# Altium schematic sheet HDMI PHY _ IO1.schdoc
size 297 x 209 mm; Symbol: Drawing-Symbol_A4; Company: 嘉立创EDA; Version: V1.0; Page Size: A4; @Project Name: RK3566; @Update Date: 2026-06-03; @Create Date: 2026-05-19; Device: Drawing-Symbol_A4; @Board Name: Board1; @Page Name: P2; @Create Time: 03:19:25; @Page Count: 8; @Page No: 8; @Schematic Name: Schematic1; @Update Time: 03:19:25; @Assembly Variant: Basic; Border: 1; Title Block Position: 3; Size: A4; Width: 1170; Height: 825; Region Start: 1; X Region Count: 6; Y Region Count: 4; Blade Width: 10; SheetNumber: 1; SheetTotal: 11
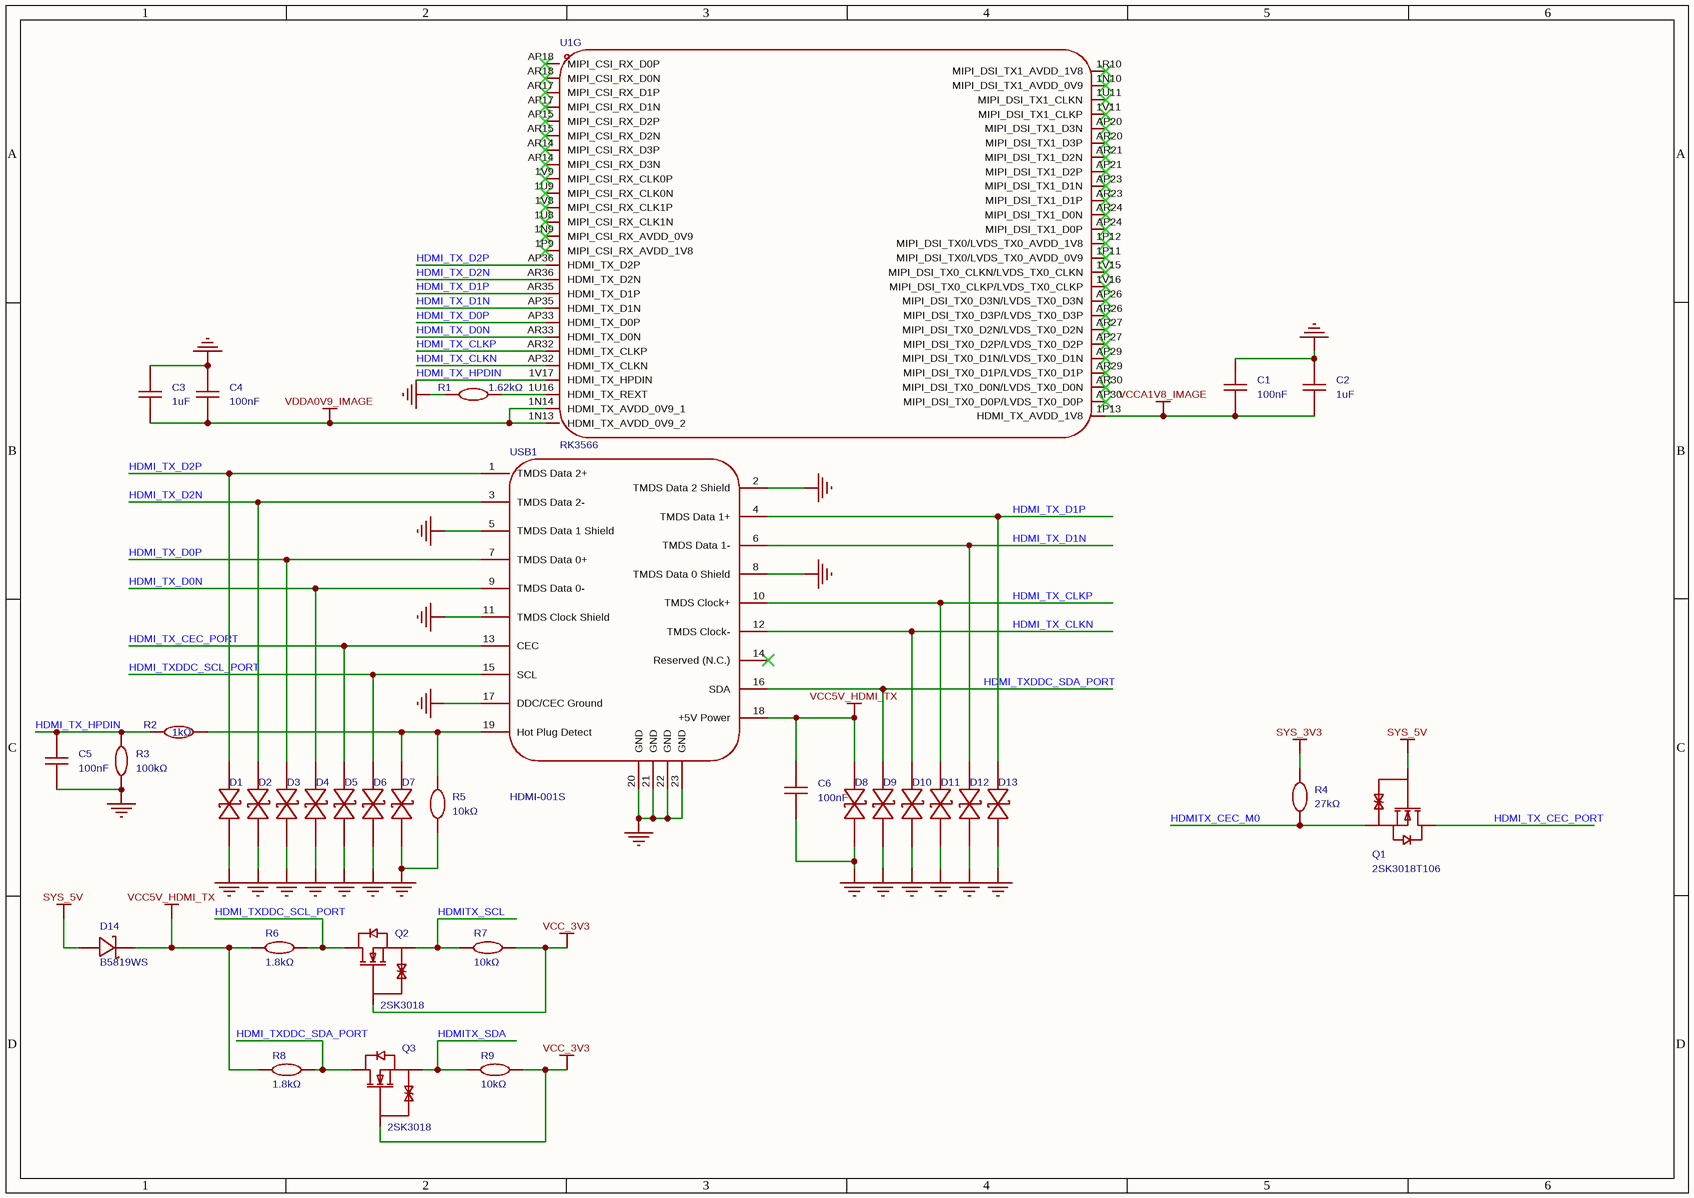
[diagram p0: HDMI PHY _ IO1.schdoc]

## Parts
C1  100nF  [C0402]
C2  1uF  [C0402]
C3  1uF  [C0402]
C4  100nF  [C0402]
C5  100nF  [C0402]
C6  100nF  [C0402]
D1  BDFN1C051R  [DFN0603-D_L0.6-W0.3-P0.34-BI]  (value not drawn)
D2  BDFN1C051R  [DFN0603-D_L0.6-W0.3-P0.34-BI]  (value not drawn)
D3  BDFN1C051R  [DFN0603-D_L0.6-W0.3-P0.34-BI]  (value not drawn)
D4  BDFN1C051R  [DFN0603-D_L0.6-W0.3-P0.34-BI]  (value not drawn)
D5  BDFN1C051R  [DFN0603-D_L0.6-W0.3-P0.34-BI]  (value not drawn)
D6  BDFN1C051R  [DFN0603-D_L0.6-W0.3-P0.34-BI]  (value not drawn)
D7  BDFN1C051R  [DFN0603-D_L0.6-W0.3-P0.34-BI]  (value not drawn)
D8  BDFN1C051R  [DFN0603-D_L0.6-W0.3-P0.34-BI]  (value not drawn)
D9  BDFN1C051R  [DFN0603-D_L0.6-W0.3-P0.34-BI]  (value not drawn)
D10  BDFN1C051R  [DFN0603-D_L0.6-W0.3-P0.34-BI]  (value not drawn)
D11  BDFN1C051R  [DFN0603-D_L0.6-W0.3-P0.34-BI]  (value not drawn)
D12  BDFN1C051R  [DFN0603-D_L0.6-W0.3-P0.34-BI]  (value not drawn)
D13  BDFN1C051R  [DFN0603-D_L0.6-W0.3-P0.34-BI]  (value not drawn)
D14  B5819WS  [SOD-323_L1.8-W1.3-LS2.5-RD]
Q1  2SK3018T106  [SOT-323_L2.0-W1.3-P1.30-LS2.1-TR]
Q2  2SK3018  [SOT-323-3_L2.0-W1.3-P1.30-LS2.1-BR]
Q3  2SK3018  [SOT-323-3_L2.0-W1.3-P1.30-LS2.1-BR]
R1  1.62kΩ  [R0402]
R2  1kΩ  [R0402]
R3  100kΩ  [R0402]
R4  27kΩ  [R0402]
R5  10kΩ  [R0402]
R6  1.8kΩ  [R0402]
R7  10kΩ  [R0402]
R8  1.8kΩ  [R0402]
R9  10kΩ  [R0402]
U1  RK3566  [BGA-565_L15.5-W14.4-P0.40_RK3566_1]  (part G of 8)
USB1  HDMI-001S  [HDMI-SMD_HDMI-001S]

## Nets
GND: C1.2 C2.2 C3.2 C4.2 C5.2 C6.2 D1.1 D2.1 D3.1 D4.1 D5.1 D6.1 D7.1 D8.1 D9.1 D10.1 D11.1 D12.1 D13.1 R1.2 R3.1 R5.1 USB1.2(TMDS_Data_2_Shield) USB1.5(TMDS_Data_1_Shield) USB1.8(TMDS_Data_0_Shield) USB1.11(TMDS_Clock_Shield) USB1.17(DDC/CEC_Ground) USB1.20(GND) USB1.21(GND) USB1.22(GND) USB1.23(GND)
SYS_3V3: R4.2
SYS_5V: D14.2(A) Q1.2(G)
VCC5V_HDMI_TX: C6.1 D8.2 D14.1(K) R6.1 R8.1 USB1.18(+5V_Power)
VCC_3V3: Q2.1(G) Q3.1(G) R7.1 R9.1
VCCA1V8_IMAGE: C1.1 C2.1 U1.1P13(HDMI_TX_AVDD_1V8)
VDDA0V9_IMAGE: C3.1 C4.1 U1.1N13(HDMI_TX_AVDD_0V9_2) U1.1N14(HDMI_TX_AVDD_0V9_1)
HDMI_TX_CEC_PORT: D5.2 Q1.3(D) USB1.13(CEC)
HDMI_TX_CLKN: D10.2 U1.AP32(HDMI_TX_CLKN) USB1.12(TMDS_Clock-)
HDMI_TX_CLKP: D11.2 U1.AR32(HDMI_TX_CLKP) USB1.10(TMDS_Clock+)
HDMI_TX_D0N: D4.2 U1.AR33(HDMI_TX_D0N) USB1.9(TMDS_Data_0-)
HDMI_TX_D0P: D3.2 U1.AP33(HDMI_TX_D0P) USB1.7(TMDS_Data_0+)
HDMI_TX_D1N: D12.2 U1.AP35(HDMI_TX_D1N) USB1.6(TMDS_Data_1-)
HDMI_TX_D1P: D13.2 U1.AR35(HDMI_TX_D1P) USB1.4(TMDS_Data_1+)
HDMI_TX_D2N: D2.2 U1.AR36(HDMI_TX_D2N) USB1.3(TMDS_Data_2-)
HDMI_TX_D2P: D1.2 U1.AP36(HDMI_TX_D2P) USB1.1(TMDS_Data_2+)
HDMI_TX_HPDIN: C5.1 R2.2 R3.2 U1.1V17(HDMI_TX_HPDIN)
HDMI_TXDDC_SCL_PORT: D6.2 Q2.3(D) R6.2 USB1.15(SCL)
HDMI_TXDDC_SDA_PORT: D9.2 Q3.3(D) R8.2 USB1.16(SDA)
HDMITX_CEC_M0: Q1.1(S) R4.1
HDMITX_SCL: Q2.2(S) R7.2
HDMITX_SDA: Q3.2(S) R9.2
NetD7_2: D7.2 R2.1 R5.2 USB1.19(Hot_Plug_Detect)
NetR1_1: R1.1 U1.1U16(HDMI_TX_REXT)

Not connected (* = marked no-connect by the designer): U1 1N9(MIPI_CSI_RX_AVDD_0V9)* 1N10(MIPI_DSI_TX1_AVDD_0V9)* 1P9(MIPI_CSI_RX_AVDD_1V8)* 1P11(MIPI_DSI_TX0/LVDS_TX0_AVDD_0V9)* 1P12(MIPI_DSI_TX0/LVDS_TX0_AVDD_1V8)* 1R10(MIPI_DSI_TX1_AVDD_1V8)* 1U8(MIPI_CSI_RX_CLK1N)* 1U9(MIPI_CSI_RX_CLK0N)* 1U11(MIPI_DSI_TX1_CLKN)* 1V8(MIPI_CSI_RX_CLK1P)* 1V9(MIPI_CSI_RX_CLK0P)* 1V11(MIPI_DSI_TX1_CLKP)* 1V15(MIPI_DSI_TX0_CLKN/LVDS_TX0_CLKN)* 1V16(MIPI_DSI_TX0_CLKP/LVDS_TX0_CLKP)* AP14(MIPI_CSI_RX_D3N)* AP15(MIPI_CSI_RX_D2P)* AP17(MIPI_CSI_RX_D1N)* AP18(MIPI_CSI_RX_D0P)* AP20(MIPI_DSI_TX1_D3N)* AP21(MIPI_DSI_TX1_D2P)* AP23(MIPI_DSI_TX1_D1N)* AP24(MIPI_DSI_TX1_D0P)* AP26(MIPI_DSI_TX0_D3N/LVDS_TX0_D3N)* AP27(MIPI_DSI_TX0_D2P/LVDS_TX0_D2P)* AP29(MIPI_DSI_TX0_D1N/LVDS_TX0_D1N)* AP30(MIPI_DSI_TX0_D0P/LVDS_TX0_D0P)* AR14(MIPI_CSI_RX_D3P)* AR15(MIPI_CSI_RX_D2N)* AR17(MIPI_CSI_RX_D1P)* AR18(MIPI_CSI_RX_D0N)* AR20(MIPI_DSI_TX1_D3P)* AR21(MIPI_DSI_TX1_D2N)* AR23(MIPI_DSI_TX1_D1P)* AR24(MIPI_DSI_TX1_D0N)* AR26(MIPI_DSI_TX0_D3P/LVDS_TX0_D3P)* AR27(MIPI_DSI_TX0_D2N/LVDS_TX0_D2N)* AR29(MIPI_DSI_TX0_D1P/LVDS_TX0_D1P)* AR30(MIPI_DSI_TX0_D0N/LVDS_TX0_D0N)*; USB1 14(Reserved_(N.C.))*

## Notes on the sheet
- 创建日期
- 2026-10-04
- 原理图
- 板子
- Schematic1
- Board1
- 更新日期
- 图页
- P2
- 绘制
- 审阅
- RK3566
- 版本
- V1.0
- 尺寸
- A4
- 页    8    共    8
- 嘉立创EDA

## Library data of the parts
C1 C4-C6 = CL05B104KO5NNNC: 容值:100nF;精度:±10%;额定电压:16V;温度系数:X7R;; Manufacturer: SAMSUNG(三星); 3D Model: 36a51122f27c49738f86b3bfa98863e0聨0819f05c4eef4c71ace90d822a990e87; 3D Model Transform: 39.37,19.685,0,0,0,0,0,0,0; Tolerance: ±10%; Voltage Rating: 16V; Temperature Coefficient: X7R; AddInBom: yes; ModelName: C0402_L1.0-W0.5-H0.5; Symbol: CL05B104KO5NNNC; Device: CL05B104KO5NNNC; LCSC Part Name: 100nF ±10% 16V; Supplier Part: C1525; Manufacturer Part: CL05B104KO5NNNC; Supplier Footprint: 0402; JLCPCB Part Class: Basic Part; Datasheet: https://item.szlcsc.com/datasheet/CL05B104KO5NNNC/1877.html; Supplier: LCSC; Value: 100nF; ConvertToPcb: yes; FootprintName: C0402
C2 C3 = HGC0402R5105K500NTEJ: 容值:1uF;精度:±10%;额定电压:50V;温度系数:X5R;; Manufacturer: Chinocera(华瓷); 3D Model: 36a51122f27c49738f86b3bfa98863e0聨0819f05c4eef4c71ace90d822a990e87; 3D Model Transform: 39.37,19.685,0,0,0,0,0,0,0; Tolerance: ±10%; Voltage Rating: 50V; Temperature Coefficient: X5R; AddInBom: yes; ModelName: C0402_L1.0-W0.5-H0.5; Symbol: HGC0402R5105K500NTEJ; Device: HGC0402R5105K500NTEJ; LCSC Part Name: 1uF ±10% 50V; Supplier Part: C7472948; Manufacturer Part: HGC0402R5105K500NTEJ; Supplier Footprint: 0402; JLCPCB Part Class: Extended Part; Datasheet: https://item.szlcsc.com/datasheet/HGC0402R5105K500NTEJ/8532795.html; Supplier: LCSC; Value: 1uF; ConvertToPcb: yes; FootprintName: C0402
D1-D13 = BDFN1C051R: 极性:双向;反向截止电压(Vrwm):5V;钳位电压:13V;峰值脉冲电流(Ipp):4A@8/20us;击穿电压(VBR):5.5V;; Manufacturer: BORN(伯恩半导体); AddInBom: yes; ModelId: 295ccb0e91f84fca9fcc42e8f031306b聨0819f05c4eef4c71ace90d822a990e87; ModelName: DFN0603-D_L0.6-W0.3--H0.3-P0.34-BI; ModelTransform: 24.0157,12.2047,0,0,0,0,0,0,0; Polarity: 双向; Reverse Stand-Off Voltage (Vrwm): 5V; Clamping Voltage: 13V; Voltage - Breakdown: 5.5V; Reverse Leakage Current (Ir): 100nA; Number of Channels: 单路; level of protection: IEC 61000-4-4；IEC 61000-4-5；IEC 61000-4-2; Type: ESD; Junction Capacitance: 0.2pF; Symbol: BDFN1C051R; Device: BDFN1C051R; LCSC Part Name: 双向ESD 5V截止 峰值脉冲电流：4A@8/20us; SupplierPart: C152032; ManufacturerPart: BDFN1C051R; Supplier Footprint: DFN0603-D; JLCPCB Part Class: Extended Part; Datasheet: https://item.szlcsc.com/datasheet/BDFN1C051R/163372.html; Supplier: LCSC; ConvertToPcb: yes; FootprintName: DFN0603-D_L0.6-W0.3-P0.34-BI; Peak Pulse Current (Ipp): 4A@8/20us
D14 = B5819WS_C22624: 直流反向耐压(Vr):40V;平均整流电流(Io):1A;正向压降(Vf):600mV@1A;; Manufacturer: CJ(江苏长电/长晶); 3D Model: e9dd044ee7bf4221b3b795eb56bce7c0; 3D Model Transform: 98.91933,51.181,0,180,0,0,0.985,-0.0005,0; Reverse Voltage (Vr): 40V; Average Rectified Current (Io): 1A; AddInBom: yes; ModelName: SOD-323_L1.7-W1.3-H1.1-LS2.5; Symbol: B5819WS_C22624; Device: B5819WS_C22624; LCSC Part Name: 40V 1A 600mV@1A; Supplier Part: C22624; Manufacturer Part: B5819WS; Supplier Footprint: SOD-323; JLCPCB Part Class: Extended Part; Datasheet: https://atta.szlcsc.com/upload/public/pdf/source/20170919/C22624_1505799673448977596.pdf; Supplier: LCSC; Forward Voltage (Vf@If): 600mV@1A; ConvertToPcb: yes; FootprintName: SOD-323_L1.8-W1.3-LS2.5-RD
Q1 = 2SK3018T106: 数量:1个N沟道;漏源电压(Vdss):30V;连续漏极电流(Id):100mA;导通电阻(RDS(on)):13Ω@2.5V;耗散功率(Pd):200mW;阈值电压(Vgs(th)):1.5V;; Manufacturer: ROHM(罗姆); AddInBom: yes; ModelId: 16cdee8f029a4e608a375d4e8ff80303聨0819f05c4eef4c71ace90d822a990e87; ModelTransform: 82.677,78.74,0,0,0,0,0,0,0; Number: 1个N沟道; Drain to Source Voltage: 30V; Current - Continuous Drain(Id): 100mA; Pd - Power Dissipation: 200mW; Gate Threshold Voltage (Vgs(th)): 1.5V; Input Capacitance(Ciss): 13pF; Reverse Transfer Capacitance (Crss@Vds): 4pF; Type: N沟道; Output Capacitance(Coss): 9pF; Vgs: ±20V; Symbol: 2SK3018T106; Device: 2SK3018T106; LCSC Part Name: 1个N沟道 耐压:30V 电流:100mA; SupplierPart: C113315; ManufacturerPart: 2SK3018T106; Supplier Footprint: SOT-323; JLCPCB Part Class: Extended Part; Datasheet: https://item.szlcsc.com/datasheet/2SK3018T106/114550.html; Supplier: LCSC; ConvertToPcb: yes; FootprintName: SOT-323_L2.0-W1.3-P1.30-LS2.1-TR; ModelName: SOT-323_L2.0-W1.3-P1.30-LS2.1-TR; RDS(on): 13Ω@2.5V; Gate Charge(Qg): -; Operating Temperature: -55℃~+150℃; Configuration: -
Q2 Q3 = 2SK3018_C194460: 类型:N沟道;漏源电压(Vdss):30V;连续漏极电流(Id):100mA;功率(Pd):200mW;导通电阻(RDS(on)@Vgs,Id):8Ω@4V,10mA;阈值电压(Vgs(th)@Id):1.5V@100uA;; Manufacturer: CJ(江苏长电/长晶); 3D Model: 59529c0d6fc749f28f2d0659e12986b4; 3D Model Transform: 78.74,82.677,0,90,0,0,0.0005,0,0; Type: N沟道; Drain Source Voltage (Vdss): 30V; Continuous Drain Current (Id): 100mA; Power Dissipation (Pd): 200mW; AddInBom: yes; ModelName: SOT-323-3_L2.0-W1.3-H1.0-LS2.1-P1.30; Symbol: 2SK3018_C194460; Device: 2SK3018_C194460; LCSC Part Name: N沟道 30V 100mA; Supplier Part: C194460; Manufacturer Part: 2SK3018; Supplier Footprint: SOT-323-3; JLCPCB Part Class: Extended Part; Datasheet: https://atta.szlcsc.com/upload/public/pdf/source/20180612/C194460_7DCC01674DB4E554C67F4CC0517F82F1.pdf; Supplier: LCSC; Drain Source On Resistance (RDS(on)@Vgs,Id): 8Ω@4V,10mA; Gate Threshold Voltage (Vgs(th)@Id): 1.5V@100uA; ConvertToPcb: yes; FootprintName: SOT-323-3_L2.0-W1.3-P1.30-LS2.1-BR
R1 = RC0402FR-071K62L: 最大工作电压:50V;工作温度范围:-55℃~+155℃;电阻长:-;精度:±1%;电阻直径:-;电阻高:-;电阻宽:-;电阻类型:厚膜电阻;功率:62.5mW;温度系数:±100ppm/℃;阻值:1.62kΩ;; Manufacturer: YAGEO(国巨); Symbol: RC-02W1621FT; 3D Model: 671aefced39d4c318694bba8bd8efd39; 3D Model Transform: 39.37,19.685,0,0,0,0,0,0.0005,0; Overload Voltage (Max): 50V; Tolerance: ±1%; Power(Watts): 62.5mW; AddInBom: yes; ModelName: R0402_L1.0-W0.5-H0.5; Device: RC0402FR-071K62L; Datasheet: https://atta.szlcsc.com/upload/public/pdf/source/20181114/C321323_9504FB1C8D32FD153B2A6FEF9347E3A6.pdf; LCSC Part Name: 1.62kΩ ±1%; Supplier Part: C138038; Manufacturer Part: RC0402FR-071K62L; Supplier Footprint: 0402; JLCPCB Part Class: Extended Part; Supplier: LCSC; Operating Temperature Range: -55℃~+155℃; Body Length: -; φD: -; Body Height: -; Body Width: -; Type: 厚膜电阻; Temperature Coefficient: ±100ppm/℃; Value: 1.62kΩ; ConvertToPcb: yes; FootprintName: R0402
R2 = 0402WGF1001TCE: 电阻类型:厚膜电阻;阻值:1kΩ;精度:±1%;功率:62.5mW;温度系数:±100ppm/℃;最大工作电压:50V;工作温度范围:-55℃~+155℃;; Manufacturer: UNI-ROYAL(厚声); 3D Model: 671aefced39d4c318694bba8bd8efd39; 3D Model Transform: 39.37,19.685,0,0,0,0,0,0.0005,0; Tolerance: ±1%; Power(Watts): 62.5mW; Overload Voltage (Max): 50V; AddInBom: yes; ModelName: R0402_L1.0-W0.5-H0.5; Symbol: 0402WGF1001TCE; Device: 0402WGF1001TCE; LCSC Part Name: 1kΩ ±1% 62.5mW; Supplier Part: C11702; Manufacturer Part: 0402WGF1001TCE; Supplier Footprint: 0402; JLCPCB Part Class: Basic Part; Datasheet: https://atta.szlcsc.com/upload/public/pdf/source/20200306/C422600_1E6D84923E4A46A82E41ADD87F860B5C.pdf; Supplier: LCSC; Type: 厚膜电阻; Value: 1kΩ; Temperature Coefficient: ±100ppm/℃; Operating Temperature Range: -55℃~+155℃; ConvertToPcb: yes; FootprintName: R0402
R3 = 0402WGF1003TCE: 电阻类型:厚膜电阻;阻值:100kΩ;精度:±1%;功率:62.5mW;温度系数:±100ppm/℃;最大工作电压:50V;工作温度范围:-55℃~+155℃;; Manufacturer: UNI-ROYAL(厚声); 3D Model: 671aefced39d4c318694bba8bd8efd39; 3D Model Transform: 39.37,19.685,0,0,0,0,0,0.0005,0; Tolerance: ±1%; Power(Watts): 62.5mW; Overload Voltage (Max): 50V; AddInBom: yes; ModelName: R0402_L1.0-W0.5-H0.5; Symbol: 0402WGF1003TCE; Device: 0402WGF1003TCE; LCSC Part Name: 100kΩ ±1% 62.5mW; Supplier Part: C25741; Manufacturer Part: 0402WGF1003TCE; Supplier Footprint: 0402; JLCPCB Part Class: Basic Part; Datasheet: https://atta.szlcsc.com/upload/public/pdf/source/20200306/C422600_1E6D84923E4A46A82E41ADD87F860B5C.pdf; Supplier: LCSC; Type: 厚膜电阻; Value: 100kΩ; Temperature Coefficient: ±100ppm/℃; Operating Temperature Range: -55℃~+155℃; Voltage-Supply(Max): 50V; Operating Temperature: -55℃~+155℃; ConvertToPcb: yes; FootprintName: R0402
R4 = FRC0402F2702TS: 电阻类型:厚膜电阻;阻值:27kΩ;精度:±1%;功率:62.5mW;工作电压:50V;温度系数:±100ppm/℃;; Manufacturer: FOJAN(富捷); AddInBom: yes; ModelId: 98c88bc2b9094f218f3a3e30a7012738聨0819f05c4eef4c71ace90d822a990e87; ModelName: R0402_L1.0-W0.5-H0.4; ModelTransform: 39.37,19.685,0,0,0,0,0,0,0; Tolerance: ±1%; Power(Watts): 62.5mW; Voltage-Supply(Max): 50V; Symbol: FRC0402F2702TS; Device: FRC0402F2702TS; LCSC Part Name: 27kΩ ±1% 62.5mW 厚膜电阻; SupplierPart: C2933084; ManufacturerPart: FRC0402F2702TS; Supplier Footprint: 0402; JLCPCB Part Class: Extended Part; Datasheet: https://item.szlcsc.com/datasheet/FRC0402F2702TS/3279186.html; Supplier: LCSC; ConvertToPcb: yes; FootprintName: R0402; Type: 厚膜电阻; Value: 27kΩ; Temperature Coefficient: ±100ppm/℃; Operating Temperature: -55℃~+155℃
R5 = FRC0402F1002TS: 电阻类型:厚膜电阻;阻值:10kΩ;精度:±1%;功率:62.5mW;工作电压:50V;温度系数:±100ppm/℃;; Manufacturer: FOJAN(富捷); 3D Model: 98c88bc2b9094f218f3a3e30a7012738聨0819f05c4eef4c71ace90d822a990e87; 3D Model Transform: 39.37,19.685,0,0,0,0,0,0,0; Tolerance: ±1%; Power(Watts): 62.5mW; Voltage-Supply(Max): 50V; AddInBom: yes; ModelName: R0402_L1.0-W0.5-H0.4; Symbol: FRC0402F1002TS; Device: FRC0402F1002TS; LCSC Part Name: 10kΩ ±1% 62.5mW 厚膜电阻; Supplier Part: C2906861; Manufacturer Part: FRC0402F1002TS; Supplier Footprint: 0402; JLCPCB Part Class: Extended Part; Datasheet: https://item.szlcsc.com/datasheet/FRC0402F1002TS/3180374.html; Supplier: LCSC; Type: 厚膜电阻; Value: 10kΩ; Temperature Coefficient: ±100ppm/℃; Operating Temperature: -55℃~+155℃; ConvertToPcb: yes; FootprintName: R0402
R6 R8 = RC0402FR-071K8L: 电阻类型:厚膜电阻;阻值:1.8kΩ;精度:±1%;功率:62.5mW;温度系数:±100ppm/℃;最大工作电压:50V;工作温度范围:-55℃~+155℃;; Manufacturer: YAGEO(国巨); 3D Model: 671aefced39d4c318694bba8bd8efd39; 3D Model Transform: 39.37,19.685,0,0,0,0,0,0.0005,0; Tolerance: ±1%; Power(Watts): 62.5mW; Overload Voltage (Max): 50V; AddInBom: yes; ModelName: R0402_L1.0-W0.5-H0.5; Symbol: RC0402FR-071K8L; Device: RC0402FR-071K8L; LCSC Part Name: 1.8kΩ ±1% 62.5mW; Supplier Part: C163481; Manufacturer Part: RC0402FR-071K8L; Supplier Footprint: 0402; JLCPCB Part Class: Extended Part; Datasheet: https://atta.szlcsc.com/upload/public/pdf/source/20180111/C163481_15156544709981259002.pdf; Supplier: LCSC; Type: 厚膜电阻; Value: 1.8kΩ; Temperature Coefficient: ±100ppm/℃; Operating Temperature Range: -55℃~+155℃; ConvertToPcb: yes; FootprintName: R0402
R7 R9 = CRCW040210K0FKED: 电阻类型:厚膜电阻;阻值:10kΩ;精度:±1%;功率:63mW;温度系数:±100ppm/K;最大工作电压:50V;工作温度范围:-55℃~+155℃;; Manufacturer: VISHAY(威世); 3D Model: 671aefced39d4c318694bba8bd8efd39; 3D Model Transform: 39.37,19.685,0,0,0,0,0,0.0005,0; Tolerance: ±1%; Power(Watts): 63mW; Overload Voltage (Max): 50V; AddInBom: yes; ModelName: R0402_L1.0-W0.5-H0.5; Symbol: CRCW040210K0FKED; Device: CRCW040210K0FKED; LCSC Part Name: 10kΩ ±1% 63mW; Supplier Part: C71617; Manufacturer Part: CRCW040210K0FKED; Supplier Footprint: 0402; JLCPCB Part Class: 扩展库; Datasheet: https://atta.szlcsc.com/upload/public/pdf/source/20180224/C71617_15194370300791364062.pdf; Supplier: LCSC; Type: 厚膜电阻; Value: 10kΩ; Temperature Coefficient: ±100ppm/K; Operating Temperature Range: -55℃~+155℃; ConvertToPcb: yes; FootprintName: R0402
U1 = RK3566: 是一款高性能、低功耗的四核应用处理器，专为个人移动互联网设备和AIoT设备设计。提供了许多嵌入式强大硬件引擎，以优化高端应用的性能。支持几乎全格式的H.264 4K@60fps解码器、H.265 4K@60fps解码器，还支持H.264/H.265 1080p@60fps编码器、高质量JPEG编码器/解码器。嵌入式3D GPU使其完全兼容OpenGL ES 1.1/2.0/3.2、OpenCL 2.0和Vulkan 1.1; Manufacturer: Rockchip(瑞芯微); Relevance: []; 3D Model: 096be4498db445d8b521581a084e15ec聨0819f05c4eef4c71ace90d822a990e87; 3D Model Transform: 610.235,566.928,0,0,0,0,0,0,0; AddInBom: yes; Symbol: RK3566; Device: RK3566; LCSC Part Name: 表面贴装型开关全行程、动作力等性能; Supplier Part: C2943786; Manufacturer Part: RK3566; Supplier Footprint: BGA-565(15.5x14.4); JLCPCB Part Class: Extended Part; Datasheet: https://item.szlcsc.com/datasheet/RK3566/3329057.html; Supplier: LCSC; ConvertToPcb: yes; FootprintName: BGA-565_L15.5-W14.4-P0.40_RK3566_1; ModelName: BGA-565_L15.5-W14.4-P0.40_RK3566_1
USB1 = HDMI-001S: 19PIN A型前插后贴HDMI插座 铜壳; Manufacturer: XUNPU(讯普); AddInBom: yes; ModelId: 95350f9f774e4f059b8c605506db97f9聨0819f05c4eef4c71ace90d822a990e87; ModelTransform: 590.5878,468.503,0,0,0,0,0,-79.567,-85.039; Connector Type: HDMI-A; Gender: 母; Symbol: HDMI-001S; Device: HDMI-001S; LCSC Part Name: HDMI-A 母 19P; SupplierPart: C720616; ManufacturerPart: HDMI-001S; Supplier Footprint: SMD; JLCPCB Part Class: Extended Part; Datasheet: https://item.szlcsc.com/datasheet/HDMI-001S/763623.html; Supplier: LCSC; ConvertToPcb: yes; FootprintName: HDMI-SMD_HDMI-001S; ModelName: HDMI-SMD_HDMI-001S; Number of Pins: 19P; Mounting Type: 卧贴; Current Rating: -; Voltage Rating: -; Operating Temperature: -